# Altium schematic sheet 09_USB.SchDoc
size 812 x 508 mm; SheetNumber: 9; SheetTotal: 16
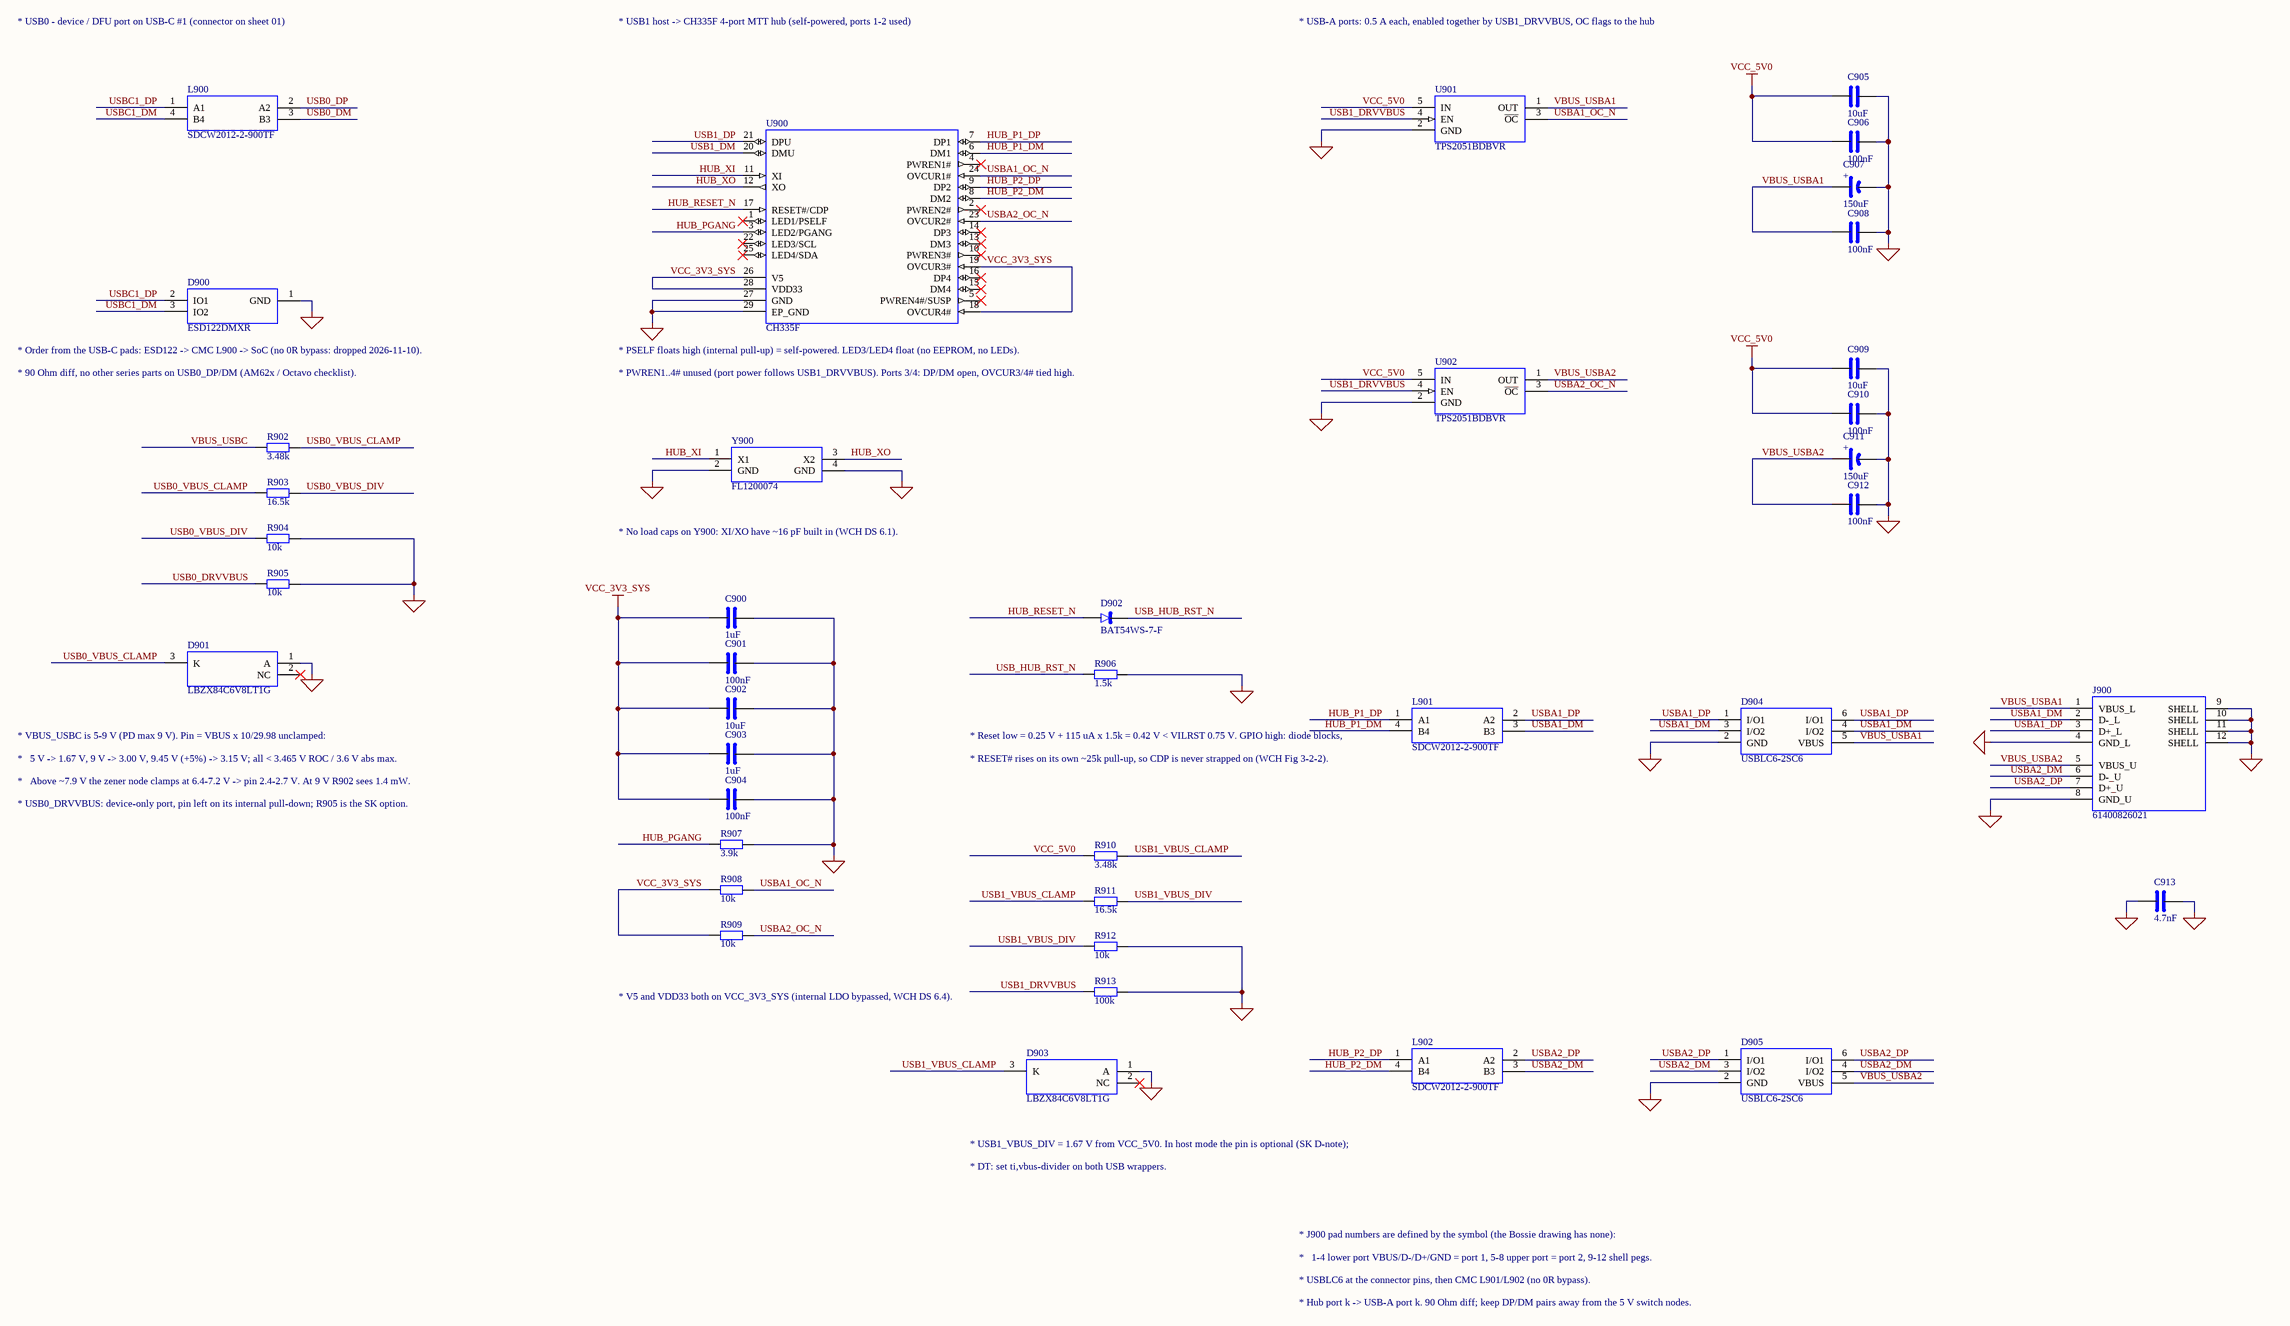
[diagram p0: 09_USB.SchDoc]

## Parts
C900  1uF  [C0402]
C901  100nF  [C0402]
C902  10uF  [C0603]
C903  1uF  [C0402]
C904  100nF  [C0402]
C905  10uF  [C0805]
C906  100nF  [C0402]
C907  150uF  [CP_SMD_D6.3X5.8]
C908  100nF  [C0402]
C909  10uF  [C0805]
C910  100nF  [C0402]
C911  150uF  [CP_SMD_D6.3X5.8]
C912  100nF  [C0402]
C913  4.7nF  [C1206]
D900  ESD122DMXR  [X2SON3_DMX]
D901  LBZX84C6V8LT1G  [SOT23-3]
D902  BAT54WS-7-F  [SOD323]
D903  LBZX84C6V8LT1G  [SOT23-3]
D904  USBLC6-2SC6  [SOT23-6]
D905  USBLC6-2SC6  [SOT23-6]
J900  61400826021  [USBA_2X_BX-TYPE-A-MWC44]
L900  SDCW2012-2-900TF  [CMC_SUNLORD_SDCW2012]
L901  SDCW2012-2-900TF  [CMC_SUNLORD_SDCW2012]
L902  SDCW2012-2-900TF  [CMC_SUNLORD_SDCW2012]
R902  3.48k  [R0402]
R903  16.5k  [R0402]
R904  10k  [R0402]
R905  10k  [R0402]
R906  1.5k  [R0402]
R907  3.9k  [R0402]
R908  10k  [R0402]
R909  10k  [R0402]
R910  3.48k  [R0402]
R911  16.5k  [R0402]
R912  10k  [R0402]
R913  100k  [R0402]
U900  CH335F  [QFN28_4X4_P0.4]
U901  TPS2051BDBVR  [SOT23-5]
U902  TPS2051BDBVR  [SOT23-5]
Y900  FL1200074  [XTAL_3225_4P]

## Nets
GND: C900.2 C901.2 C902.2 C903.2 C904.2 C905.2 C906.2 C907.2 C908.2 C909.2 C910.2 C911.2 C912.2 C913.1 C913.2 D900.1(GND) D901.1(A) D903.1(A) D904.2(GND) D905.2(GND) J900.4(GND_L) J900.8(GND_U) J900.9(SHELL) J900.10(SHELL) J900.11(SHELL) J900.12(SHELL) R904.2 R905.2 R906.2 R907.2 R912.2 R913.2 U900.27(GND) U900.29(EP_GND) U901.2(GND) U902.2(GND) Y900.2(GND) Y900.4(GND)
VCC_3V3_SYS: C900.1 C901.1 C902.1 C903.1 C904.1 R908.1 R909.1 U900.18(OVCUR4#) U900.19(OVCUR3#) U900.26(V5) U900.28(VDD33)
VCC_5V0: C905.1 C906.1 C909.1 C910.1 R910.1 U901.5(IN) U902.5(IN)
HUB_P1_DM: L901.4(B4) U900.6(DM1)
HUB_P1_DP: L901.1(A1) U900.7(DP1)
HUB_P2_DM: L902.4(B4) U900.8(DM2)
HUB_P2_DP: L902.1(A1) U900.9(DP2)
HUB_PGANG: R907.1 U900.3(LED2/PGANG)
HUB_RESET_N: D902.1(A) U900.17(RESET#/CDP)
HUB_XI: U900.11(XI) Y900.1(X1)
HUB_XO: U900.12(XO) Y900.3(X2)
USB0_DM: L900.3(B3)
USB0_DP: L900.2(A2)
USB0_DRVVBUS: R905.1
USB0_VBUS_CLAMP: D901.3(K) R902.2 R903.1
USB0_VBUS_DIV: R903.2 R904.1
USB1_DM: U900.20(DMU)
USB1_DP: U900.21(DPU)
USB1_DRVVBUS: R913.1 U901.4(EN) U902.4(EN)
USB1_VBUS_CLAMP: D903.3(K) R910.2 R911.1
USB1_VBUS_DIV: R911.2 R912.1
USB_HUB_RST_N: D902.2(K) R906.1
USBA1_DM: D904.3(I/O2) D904.4(I/O2) J900.2(D-_L) L901.3(B3)
USBA1_DP: D904.1(I/O1) D904.6(I/O1) J900.3(D+_L) L901.2(A2)
USBA1_OC_N: R908.2 U900.24(OVCUR1#) U901.3(~{OC})
USBA2_DM: D905.3(I/O2) D905.4(I/O2) J900.6(D-_U) L902.3(B3)
USBA2_DP: D905.1(I/O1) D905.6(I/O1) J900.7(D+_U) L902.2(A2)
USBA2_OC_N: R909.2 U900.23(OVCUR2#) U902.3(~{OC})
USBC1_DM: D900.3(IO2) L900.4(B4)
USBC1_DP: D900.2(IO1) L900.1(A1)
VBUS_USBA1: C907.1 C908.1 D904.5(VBUS) J900.1(VBUS_L) U901.1(OUT)
VBUS_USBA2: C911.1 C912.1 D905.5(VBUS) J900.5(VBUS_U) U902.1(OUT)
VBUS_USBC: R902.1

Not connected (* = marked no-connect by the designer): D901 2(NC)*; D903 2(NC)*; U900 1(LED1/PSELF)* 2(PWREN2#)* 4(PWREN1#)* 5(PWREN4#/SUSP)* 10(PWREN3#)* 13(DM3)* 14(DP3)* 15(DM4)* 16(DP4)* 22(LED3/SCL)* 25(LED4/SDA)*

## Notes on the sheet
- * USB0 - device / DFU port on USB-C #1 (connector on sheet 01)
- * USB1 host -> CH335F 4-port MTT hub (self-powered, ports 1-2 used)
- * USB-A ports: 0.5 A each, enabled together by USB1_DRVVBUS, OC flags to the hub
- (near D900) * Order from the USB-C pads: ESD122 -> CMC L900 -> SoC (no 0R bypass: dropped 2026-11-10).
- * 90 Ohm diff, no other series parts on USB0_DP/DM (AM62x / Octavo checklist).
- (near U900) * PSELF floats high (internal pull-up) = self-powered. LED3/LED4 float (no EEPROM, no LEDs).
- * PWREN1..4# unused (port power follows USB1_DRVVBUS). Ports 3/4: DP/DM open, OVCUR3/4# tied high.
- * No load caps on Y900: XI/XO have ~16 pF built in (WCH DS 6.1).
- * VBUS_USBC is 5-9 V (PD max 9 V). Pin = VBUS x 10/29.98 unclamped:
- (near L901) * Reset low = 0.25 V + 115 uA x 1.5k = 0.42 V < VILRST 0.75 V. GPIO high: diode blocks,
- *   5 V -> 1.67 V, 9 V -> 3.00 V, 9.45 V (+5%) -> 3.15 V; all < 3.465 V ROC / 3.6 V abs max.
- *   Above ~7.9 V the zener node clamps at 6.4-7.2 V -> pin 2.4-2.7 V. At 9 V R902 sees 1.4 mW.
- (near L901) * RESET# rises on its own ~25k pull-up, so CDP is never strapped on (WCH Fig 3-2-2).
- * USB0_DRVVBUS: device-only port, pin left on its internal pull-down; R905 is the SK option.
- * V5 and VDD33 both on VCC_3V3_SYS (internal LDO bypassed, WCH DS 6.4).
- * USB1_VBUS_DIV = 1.67 V from VCC_5V0. In host mode the pin is optional (SK D-note);
- * DT: set ti,vbus-divider on both USB wrappers.
- * J900 pad numbers are defined by the symbol (the Bossie drawing has none):
- *   1-4 lower port VBUS/D-/D+/GND = port 1, 5-8 upper port = port 2, 9-12 shell pegs.
- * USBLC6 at the connector pins, then CMC L901/L902 (no 0R bypass).
- * Hub port k -> USB-A port k. 90 Ohm diff; keep DP/DM pairs away from the 5 V switch nodes.
- (in symbol CAP_POL) +

## Library data of the parts
C900 = CAP: Capacitor, non-polarized; Spec: 1uF 10V X5R 0402 (V5 pin 26)
C901 = CAP: Capacitor, non-polarized; MPN: CL05B104KO5NNNC; Manufacturer: Samsung; Spec: 100nF 16V X7R 0402 (V5 pin 26); LCSC: C1525
C902 = CAP: Capacitor, non-polarized; Spec: 10uF 10V X5R 0603 (VDD33 pin 28)
C903 = CAP: Capacitor, non-polarized; Spec: 1uF 10V X5R 0402 (VDD33 pin 28)
C904 = CAP: Capacitor, non-polarized; MPN: CL05B104KO5NNNC; Manufacturer: Samsung; Spec: 100nF 16V X7R 0402 (VDD33 pin 28); LCSC: C1525
C905 C909 = CAP: Capacitor, non-polarized; MPN: CL21A106KAYNNNE; Manufacturer: Samsung; Spec: 10uF 25V X5R 0805 (switch IN); LCSC: C15850
C906 C910 = CAP: Capacitor, non-polarized; MPN: CL05B104KO5NNNC; Manufacturer: Samsung; Spec: 100nF 16V X7R 0402 (switch IN); LCSC: C1525
C907 C911 = CAP_POL: Capacitor, polarized (pin 1 = +); MPN: RYHV10V150UF6*5; Manufacturer: Honor Elec; Spec: 150uF 10V polymer (USB 2.0 >= 120 uF); LCSC: C48970647
C908 C912 = CAP: Capacitor, non-polarized; MPN: CL05B104KO5NNNC; Manufacturer: Samsung; Spec: 100nF 16V X7R 0402 (at connector); LCSC: C1525
C913 = CAP: Capacitor, non-polarized; DNP: 1; Spec: 4.7nF 2kV X7R 1206 DNP (SK C372 option)
D900 = ESD122_DMX: ESD122 2-channel 0.2 pF bidirectional ESD diode, X2SON-3 (DMX); Manufacturer: Texas Instruments; MPN: ESD122DMXR; LCSC: C544474
D901 D903 = BZX84_SOT23: Zener diode SOT-23 (1 = anode, 2 = NC, 3 = cathode); Manufacturer: LRC; Spec: LBZX84C6V8LT1G 6.8V; MPN: LBZX84C6V8LT1G; LCSC: C12746
D902 = DIODE: Diode (pin 1 = anode); Manufacturer: Diodes Inc; Spec: BAT54WS-7-F (anode at hub); MPN: BAT54WS-7-F; LCSC: C124205
D904 D905 = USBLC6-2SC6: USBLC6-2 2-line USB ESD array with VBUS clamp, SOT23-6L; Manufacturer: STMicroelectronics; MPN: USBLC6-2SC6; LCSC: C7519
J900 = BX-TYPE-A-MWC44: Dual stacked USB 2.0 Type-A receptacle, THT right angle (Bossie BX-TYPE-A-MWC44); Manufacturer: Wurth Elektronik; MPN: 61400826021; Supplier: Mouser 710-61400826021
L900-L902 = SDCW2012-2: Sunlord SDCW2012-2 wire-wound 2-line common-mode choke, 0805; Spec: SDCW2012-2-900TF 90R@100MHz; MPN: SDCW2012-2-900TF; Manufacturer: Sunlord; LCSC: C54888
R902 R910 = RES: Resistor; Spec: 3.48k 1% 0402
R903 R911 = RES: Resistor; Spec: 16.5k 1% 0402
R904 R912 = RES: Resistor; Spec: 10k 1% 0402
R905 = RES: Resistor; DNP: 1; Spec: 10k 0402 DNP (device-only port)
R906 = RES: Resistor; Spec: 1.5k 0402 (holds hub in reset while SoC pads are off)
R907 = RES: Resistor; Spec: 3.9k 0402 (PGANG low = independent OC)
R908 R909 = RES: Resistor; Spec: 10k 0402 (TPS2051B OC pull-up)
R913 = RES: Resistor; Spec: 100k 0402 (keeps USB-A power off while the SoC IO is unpowered; DNP only for USB1 deep-sleep wake)
U900 = CH335F: WCH CH335F USB 2.0 HS 4-port MTT hub, per-port power/OC, QFN-28 4x4; Manufacturer: WCH (Jiangsu Qin Heng); MPN: CH335F; LCSC: C5137013
U901 U902 = TPS2051B_DBV: TPS2051B 0.5 A USB power switch, active-high EN, OC flag, SOT-23-5; Manufacturer: Texas Instruments; MPN: TPS2051BDBVR; LCSC: C24593
Y900 = XTAL_YSX321SL: Crystal 3.2x2.5 mm 4-pad, YXC YSX321SL (1/3 crystal, 2/4 GND); Manufacturer: Diodes Incorporated; Spec: FL1200074 12MHz 20pF 20ppm; MPN: FL1200074; Supplier: Digi-Key FL1200074